# EAGLE schematic 1795187984444_fontanka (EAGLE 9.6.2)
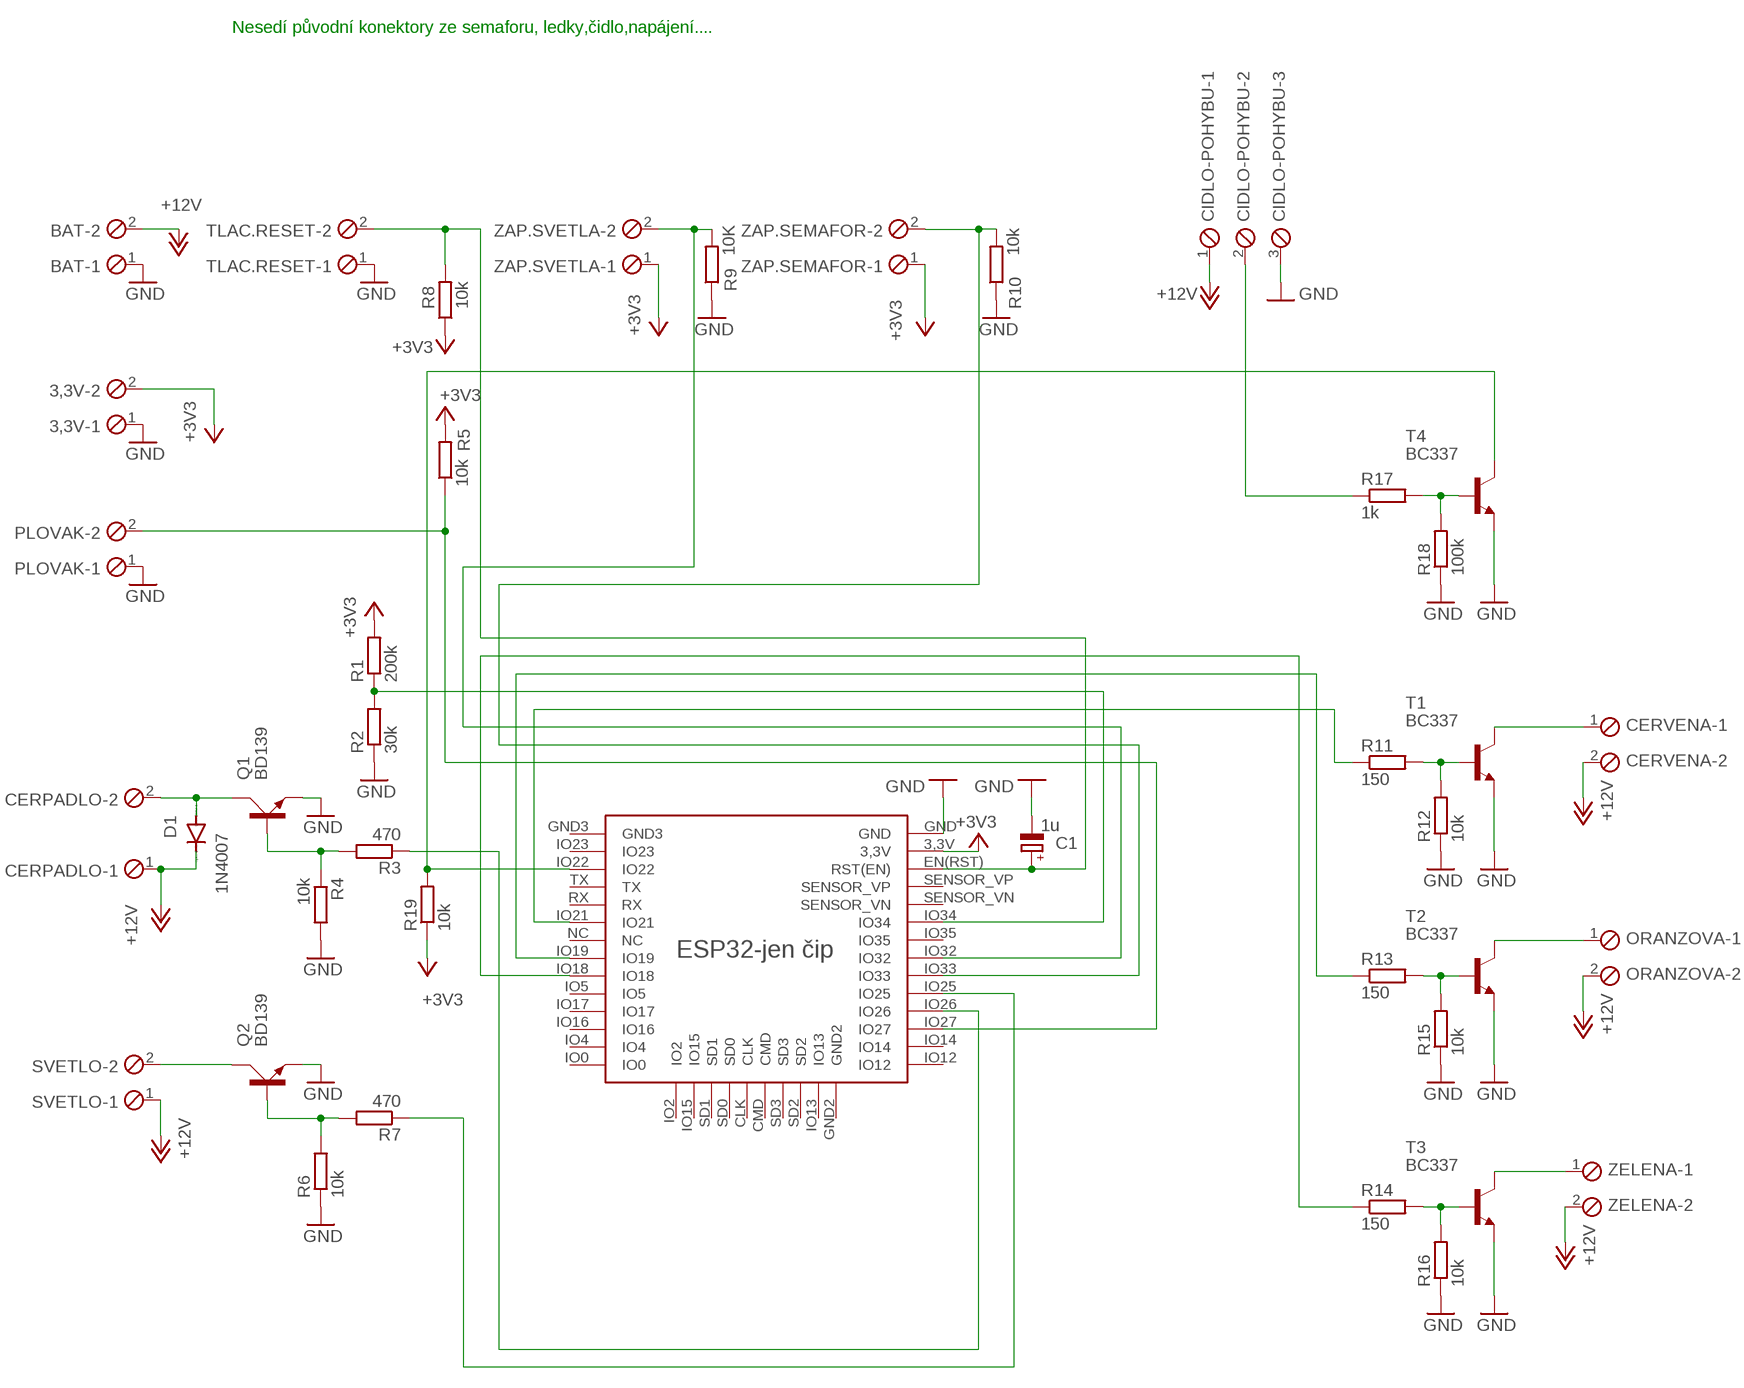
[diagram p0: schematic, sheet 1]

## Parts
3,3V  MPT2  [2POL254]
BAT  MPT2  [2POL254]
C1  1u  CPOL-EUE2,5-6E  [E2,5-6E]
CERPADLO  MPT2  [2POL254]
CERVENA  MPT2  [2POL254]
CIDLO-POHYBU  MPT3  [3POL254]
D1  1N4007  1N4004  [DO41-10]
ORANZOVA  MPT2  [2POL254]
PLOVAK  MPT2  [2POL254]
Q1  BD139  [TO126AV]
Q2  BD139  [TO126AV]
R1  200k  R-EU_0204/7  [0204/7]
R2  30k  R-EU_0204/7  [0204/7]
R3  470  R-EU_0204/7  [0204/7]
R4  10k  R-EU_0204/7  [0204/7]
R5  10k  R-EU_0204/7  [0204/7]
R6  10k  R-EU_0204/7  [0204/7]
R7  470  R-EU_0204/7  [0204/7]
R8  10k  R-EU_0204/7  [0204/7]
R9  10K  R-EU_0204/7  [0204/7]
R10  10k  R-EU_0204/7  [0204/7]
R11  150  R-EU_0204/7  [0204/7]
R12  10k  R-EU_0204/7  [0204/7]
R13  150  R-EU_0204/7  [0204/7]
R14  150  R-EU_0204/7  [0204/7]
R15  10k  R-EU_0204/7  [0204/7]
R16  10k  R-EU_0204/7  [0204/7]
R17  1k  R-EU_0204/7  [0204/7]
R18  100k  R-EU_0204/7  [0204/7]
R19  10k  R-EU_0204/7  [0204/7]
SVETLO  MPT2  [2POL254]
T1  BC337  BC337-NPN-TO92-CBE  [TO92-CBE]
T2  BC337  BC337-NPN-TO92-CBE  [TO92-CBE]
T3  BC337  BC337-NPN-TO92-CBE  [TO92-CBE]
T4  BC337  BC337-NPN-TO92-CBE  [TO92-CBE]
TLAC.RESET  MPT2  [2POL254]
U$2  ESP32-PATICEESP32-2,54PIN  [ESP32-PATICE2,54]
ZAP.SEMAFOR  MPT2  [2POL254]
ZAP.SVETLA  MPT2  [2POL254]
ZELENA  MPT2  [2POL254]

## Nets
+3V3: 3,3V.2 R1.2 R5.2 R8.1 R19.1 U$2.3,3V ZAP.SEMAFOR.1 ZAP.SVETLA.1
+12V: BAT.2 CERPADLO.1 CERVENA.2 CIDLO-POHYBU.1 D1.C ORANZOVA.2 SVETLO.1 ZELENA.2
GND: 3,3V.1 BAT.1 C1.- CIDLO-POHYBU.3 PLOVAK.1 Q1.E Q2.E R2.1 R4.2 R6.1 R9.1 R10.1 R12.1 R15.1 R16.1 R18.1 T1.E T2.E T3.E T4.E TLAC.RESET.1 U$2.GND
N$1: R1.1 R2.2 U$2.IO34
N$2: R3.1 U$2.IO26
N$3: Q1.B R3.2 R4.1
N$4: CERPADLO.2 D1.A Q1.C
N$5: R19.2 T4.C U$2.IO22
N$6: R11.1 U$2.IO21
N$7: PLOVAK.2 R5.1 U$2.IO27
N$8: C1.+ R8.2 TLAC.RESET.2 U$2.EN(RST)(RST(EN))
N$9: R7.1 U$2.IO25
N$10: Q2.B R6.2 R7.2
N$11: R9.2 U$2.IO32 ZAP.SVETLA.2
N$12: R10.2 U$2.IO33 ZAP.SEMAFOR.2
N$14: R11.2 R12.2 T1.B
N$15: R13.1 U$2.IO19
N$16: R14.1 U$2.IO18
N$17: R13.2 R15.2 T2.B
N$18: R14.2 R16.2 T3.B
N$19: T3.C ZELENA.1
N$20: ORANZOVA.1 T2.C
N$21: CERVENA.1 T1.C
N$22: R17.2 R18.2 T4.B
N$23: CIDLO-POHYBU.2 R17.1
SVETLO: Q2.C SVETLO.2
Unconnected: U$2.CLK U$2.CMD U$2.GND2 U$2.GND3 U$2.IO0 U$2.IO2 U$2.IO4 U$2.IO5 U$2.IO12 U$2.IO13 U$2.IO14 U$2.IO15 U$2.IO16 U$2.IO17 U$2.IO23 U$2.IO35 U$2.NC U$2.RX U$2.SD0 U$2.SD1 U$2.SD2 U$2.SD3 U$2.SENSOR_VN U$2.SENSOR_VP U$2.TX

## Notes on the sheet
- Nesedí původní konektory ze semaforu, ledky,čidlo,napájení....

## Library data of the parts
3,3V BAT CERPADLO CERVENA ORANZOVA PLOVAK SVETLO TLAC.RESET ZAP.SEMAFOR ZAP.SVETLA ZELENA = con-phoenix-254:MPT2: PHOENIX CONNECTOR; OC_FARNELL: unknown; OC_NEWARK: unknown
C1 = rcl-vetši pad:CPOL-EU: POLARIZED CAPACITOR, European symbol; SPICEPREFIX: C
CIDLO-POHYBU = con-phoenix-254:MPT3: PHOENIX CONNECTOR; OC_FARNELL: unknown; OC_NEWARK: unknown
D1 = diode:1N4004: DIODE general purpose rectifier, 1 A
Q1 Q2 = transistor-power:BD139: NPN TRANSISTOR
R1-R19 = rcl-vetši pad:R-EU_: RESISTOR, European symbol; SPICEPREFIX: R
T1-T4 = transistor:*-NPN-: NPN Transistror BF959 corrected 2008.03.06
U$2 = ESP32-jen čip:ESP32-PATICE